# EAGLE design HPFC-V1 (EAGLE 9.7.0)
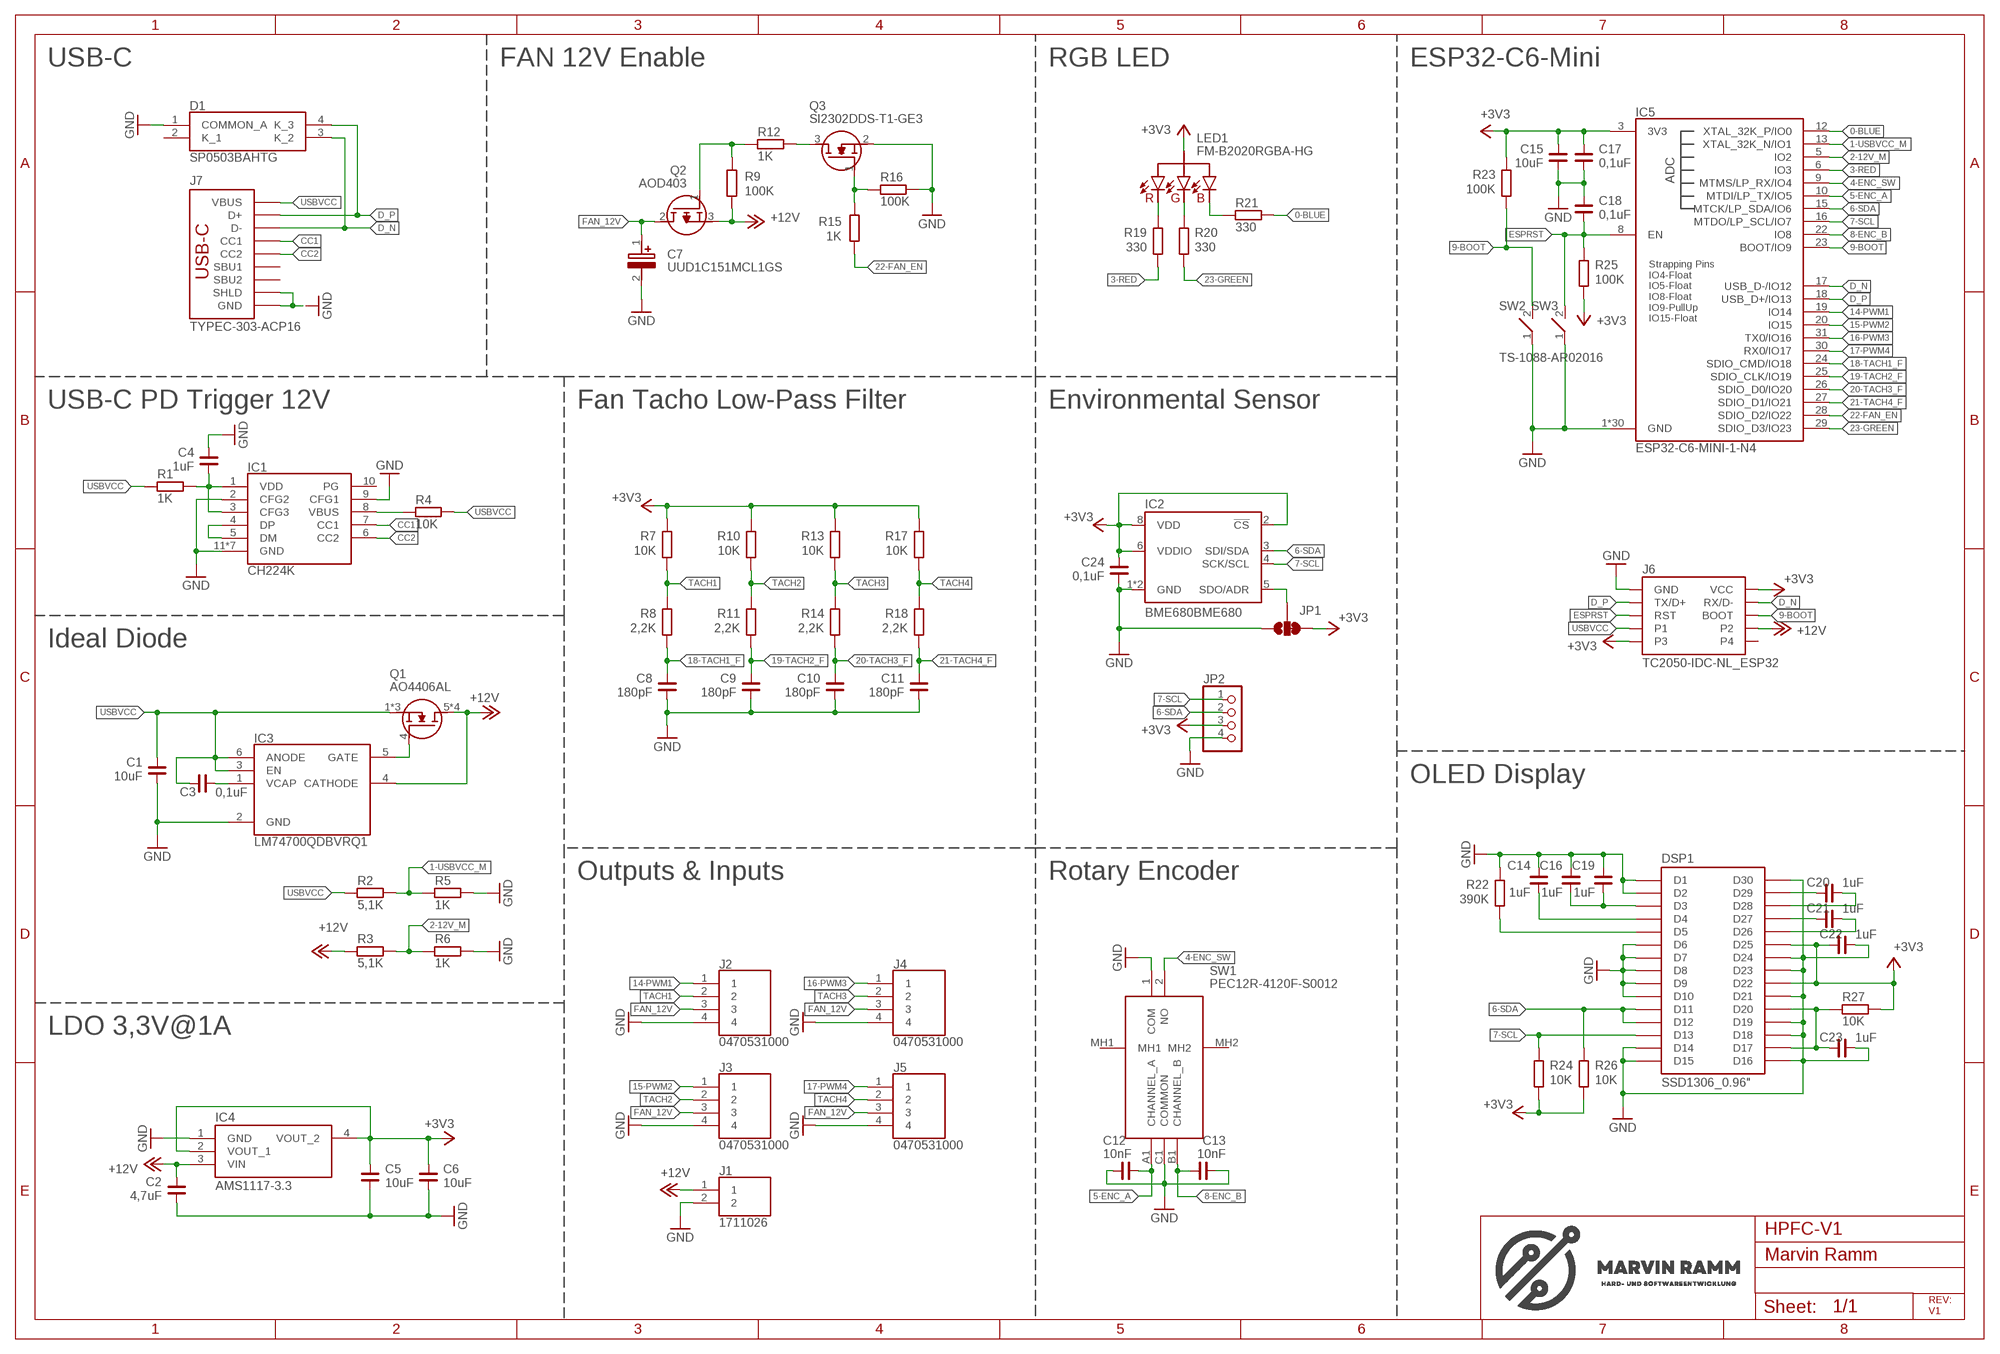
[diagram p0: schematic, sheet 1]

## Parts
C1  10uF  C_900603  [C0603]
C2  4,7uF  C_900603  [C0603]
C3  0,1uF  C_0402  [C0402]
C4  1uF  C_900402  [C0402]
C5  10uF  C_900603  [C0603]
C6  10uF  C_900603  [C0603]
C7  UUD1C151MCL1GS  [CAPAE660X800N]
C8  180pF  C_900402  [C0402]
C9  180pF  C_900402  [C0402]
C10  180pF  C_900402  [C0402]
C11  180pF  C_900402  [C0402]
C12  10nF  C_0402  [C0402]
C13  10nF  C_0402  [C0402]
C14  1uF  C_900402  [C0402]
C15  10uF  C_900603  [C0603]
C16  1uF  C_900402  [C0402]
C17  0,1uF  C_900402  [C0402]
C18  0,1uF  C_900402  [C0402]
C19  1uF  C_900402  [C0402]
C20  1uF  C_0402  [C0402]
C21  1uF  C_0402  [C0402]
C22  1uF  C_0402  [C0402]
C23  1uF  C_0402  [C0402]
C24  0,1uF  C_900402  [C0402]
D1  SP0503BAHTG  [SP0503BAHTG]
DSP1  SSD1306_0.96"  [SSD1306_0.96"]
IC1  CH224K  [SOP100P600X180-11N]
IC2  BME680BME680  [LGA3.0X3.0]
IC3  LM74700QDBVRQ1  [SOT95P280X145-6N]
IC4  AMS1117-3.3  [SOT229P700X180-4N]
IC5  ESP32-C6-MINI-1-N4  [ESP32C6MINI1N4]
J1  1711026  [1711026]
J2  0470531000  [0470531000]
J3  0470531000  [0470531000]
J4  0470531000  [0470531000]
J5  0470531000  [0470531000]
J6  TC2050-IDC-NL_ESP32  [TC2050-IDC-NL]
J7  TYPEC-303-ACP16  [TYPEC-303-ACP16]
JP1  JUMPER-SMT_3_1-NC_TRACE_SILK  [SMT-JUMPER_3_1-NC_TRACE_SILK]
JP2  PINHD-1X4  [1X04]
LED1  FM-B2020RGBA-HG  [FMB2020RGBAHG]
Q1  AO4406AL  [SOIC127P600X175-8N]
Q2  AOD403  [AOD480]
Q3  SI2302DDS-T1-GE3  [SOT95P237X112-3N]
R1  1K  R_0402  [R0402]
R2  5,1K  R_0402  [R0402]
R3  5,1K  R_0402  [R0402]
R4  10K  R_0402  [R0402]
R5  1K  R_0402  [R0402]
R6  1K  R_0402  [R0402]
R7  10K  R_900402  [R0402]
R8  2,2K  R_900402  [R0402]
R9  100K  R_0402  [R0402]
R10  10K  R_900402  [R0402]
R11  2,2K  R_900402  [R0402]
R12  1K  R_0402  [R0402]
R13  10K  R_900402  [R0402]
R14  2,2K  R_900402  [R0402]
R15  1K  R_0402  [R0402]
R16  100K  R_0402  [R0402]
R17  10K  R_900402  [R0402]
R18  2,2K  R_900402  [R0402]
R19  330  R_900402  [R0402]
R20  330  R_900402  [R0402]
R21  330  R_0402  [R0402]
R22  390K  R_900402  [R0402]
R23  100K  R_900402  [R0402]
R24  10K  R_900402  [R0402]
R25  100K  R_900402  [R0402]
R26  10K  R_900402  [R0402]
R27  10K  R_0402  [R0402]
SW1  PEC12R-4120F-S0012  [PEC12R4230FS0024]
SW2  TS-1088-AR02016  [TS1088AR02016]
SW3  TS-1088-AR02016  [TS1088AR02016]

## Nets
0-BLUE: IC5.12(XTAL_32K_P/IO0) R21.2
1-USBVCC_M: IC5.13(XTAL_32K_N/IO1) R2.2 R5.1
2-12V_M: IC5.5(IO2) R3.2 R6.1
3-RED: IC5.6(IO3) R19.2
4-ENC_SW: IC5.9(MTMS/LP_RX/IO4) SW1.2(NO)
5-ENC_A: C12.2 IC5.10(MTDI/LP_TX/IO5) SW1.A1(CHANNEL_A)
6-SDA: DSP1.D11 DSP1.D12 IC2.3(SDI/SDA) IC5.15(MTCK/LP_SDA/IO6) JP2.2 R26.1
7-SCL: DSP1.D13 IC2.4(SCK/SCL) IC5.16(MTDO/LP_SCL/IO7) JP2.1 R24.1
8-ENC_B: C13.2 IC5.22(IO8) SW1.B1(CHANNEL_B)
9-BOOT: IC5.23(BOOT/IO9) J6.6(BOOT) R23.2 SW2.2(NO)
14-PWM1: IC5.19(IO14) J2.1
15-PWM2: IC5.20(IO15) J3.1
16-PWM3: IC5.31(TX0/IO16) J4.1
17-PWM4: IC5.30(RX0/IO17) J5.1
18-TACH1_F: C8.2 IC5.24(SDIO_CMD/IO18) R8.2
19-TACH2_F: C9.2 IC5.25(SDIO_CLK/IO19) R11.2
20-TACH3_F: C10.2 IC5.26(SDIO_D0/IO20) R14.2
21-TACH4_F: C11.2 IC5.27(SDIO_D1/IO21) R18.2
22-FAN_EN: IC5.28(SDIO_D2/IO22) R15.1
23-GREEN: IC5.29(SDIO_D3/IO23) R20.2
+3V3: C5.2 C6.2 C15.2 C17.2 C22.1 C24.2 DSP1.D22 DSP1.D25 IC2.2(!CS) IC2.6(VDDIO) IC2.8(VDD) IC4.2(VOUT_1) IC4.4(VOUT_2) IC5.3(3V3) J6.2(VCC) J6.9(P3) JP1.3 JP2.3 LED1.3(VCC) R7.1 R10.1 R13.1 R17.1 R23.1 R24.2 R25.2 R26.2 R27.2
+12V: C2.2 IC3.4(CATHODE) IC4.3(VIN) J1.1 J6.8(P2) Q1.5(D) Q1.6(D) Q1.7(D) Q1.8(D) Q2.3(S) R3.1 R9.1
CC1: IC1.7(CC1) J7.A5(CC1)
CC2: IC1.6(CC2) J7.B5(CC2)
D_N: D1.3(K_2) IC5.17(USB_D-/IO12) J6.4(RX/D-) J7.A7(D-) J7.B7(D-)
D_P: D1.4(K_3) IC5.18(USB_D+/IO13) J6.3(TX/D+) J7.A6(D+) J7.B6(D+)
ESPRST: C18.1 IC5.8(EN) J6.5(RST) R25.1 SW3.2(NO)
FAN_12V: C7.1(+) J2.3 J3.3 J4.3 J5.3 Q2.2(D)
GND: C1.1 C2.1 C4.2 C5.1 C6.1 C7.2(-) C8.1 C9.1 C10.1 C11.1 C12.1 C13.1 C14.2 C15.1 C16.2 C17.1 C18.2 C19.2 C22.2 C23.2 C24.1 D1.1(COMMON_A) DSP1.D1 DSP1.D2 DSP1.D6 DSP1.D7 DSP1.D8 DSP1.D9 DSP1.D10 DSP1.D14 DSP1.D15 DSP1.D16 DSP1.D18 DSP1.D19 DSP1.D21 DSP1.D23 DSP1.D24 DSP1.D30 IC1.2(CFG2) IC1.9(CFG1) IC1.11(GND) IC1.P$1(GND) IC1.P$2(GND) IC1.P$3(GND) IC1.P$4(GND) IC1.P$5(GND) IC1.P$6(GND) IC2.1(GND) IC2.7(GND) IC3.2(GND) IC4.1(GND) IC5.1(GND) IC5.2(GND) IC5.11(GND) IC5.14(GND) IC5.36(GND) IC5.37(GND) IC5.38(GND) IC5.39(GND) IC5.40(GND) IC5.41(GND) IC5.42(GND) IC5.43(GND) IC5.44(GND) IC5.45(GND) IC5.46(GND) IC5.47(GND) IC5.48(GND) IC5.49(GND) IC5.50(GND) IC5.51(GND) IC5.52(GND) IC5.53(GND) IC5.54(GND) IC5.55(GND) IC5.56(GND) IC5.57(GND) IC5.58(GND) IC5.59(GND) IC5.60(GND) IC5.61(GND) J1.2 J2.4 J3.4 J4.4 J5.4 J6.1(GND) J7.A1(GND) J7.A12(GND) J7.B1(GND) J7.B12(GND) J7.PD1(SHLD) J7.PD2(SHLD) J7.PD3(SHLD) J7.PD4(SHLD) JP1.1 JP2.4 Q3.2(S) R5.2 R6.2 R16.2 R22.1 SW1.1(COM) SW1.C1(COMMON) SW2.1(COM) SW3.1(COM)
N$1: C4.1 IC1.1(VDD) IC1.3(CFG3) R1.2
N$2: IC1.4(DP) IC1.5(DM)
N$3: IC1.8(VBUS) R4.1
N$4: IC3.5(GATE) Q1.4(G1)
N$5: LED1.2(B) R21.1
N$6: IC2.5(SDO/ADR) JP1.2
N$7: C3.2 IC3.1(VCAP)
N$8: Q2.1(G) R9.2 R12.1
N$10: Q3.3(D) R12.2
N$11: Q3.1(G) R15.2 R16.1
N$19: LED1.1(R) R19.1
N$20: LED1.4(G) R20.1
N$21: DSP1.D5 R22.2
N$22: C16.1 C19.1 DSP1.D3
N$23: C20.1 DSP1.D29
N$24: C14.1 DSP1.D4
N$25: C20.2 DSP1.D28
N$26: C21.1 DSP1.D27
N$27: C21.2 DSP1.D26
N$29: C23.1 DSP1.D17 DSP1.D20 R27.1
TACH1: J2.2 R7.2 R8.1
TACH2: J3.2 R10.2 R11.1
TACH3: J4.2 R13.2 R14.1
TACH4: J5.2 R17.2 R18.1
USBVCC: C1.2 C3.1 IC3.3(EN) IC3.6(ANODE) J6.7(P1) J7.A4(VBUS) J7.A9(VBUS) J7.B4(VBUS) J7.B9(VBUS) Q1.1(S) Q1.2(S) Q1.3(S) R1.1 R2.1 R4.2
Unconnected: D1.2(K_1) IC1.10(PG) J6.10(P4) J7.A8(SBU1) J7.B8(SBU2) SW1.MH1 SW1.MH2

## Notes on the sheet
- USB-C | FAN 12V Enable | RGB LED | ESP32-C6-Mini
- USB-C PD Trigger 12V | Fan Tacho Low-Pass Filter | Environmental Sensor
- Ideal Diode
- OLED Display
- Outputs & Inputs | Rotary Encoder
- LDO 3,3V@1A
- Marvin Ramm
- REV:
  V1

## Library data of the parts
C1 C2 C4-C6 C8-C11 C14-C19 C24 = rc-master-smd:C_90: NON-POLARIZED CAP
C3 C12 C13 C20-C23 = rc-master-smd:C_: NON-POLARIZED CAP
C7 = UUD1C151MCL1GS:UUD1C151MCL1GS: Cap Aluminum Lytic 150uF 16V 20% (6.3 X 7.7mm) SMD 280mA 2000h 105C Automotive T/R Source: Datasheet <https://datasheet.datasheetarchive.com/originals/dk/DKDS-9/176751.pdf>; ARROW_PART_NUMBER: UUD1C151MCL1GS; ARROW_PRICE-STOCK: https://www.arrow.com/en/products/uud1c151mcl1gs/nichicon; DESCRIPTION: Cap Aluminum Lytic 150uF 16V 20% (6.3 X 7.7mm) SMD 280mA 2000h 105C Automotive T/R; HEIGHT: 8mm; MANUFACTURER_NAME: Nichicon; MANUFACTURER_PART_NUMBER: UUD1C151MCL1GS; MOUSER_PART_NUMBER: 647-UUD1C151MCL; MOUSER_PRICE-STOCK: https://www.mouser.co.uk/ProductDetail/Nichicon/UUD1C151MCL1GS?qs=BJlw7L4Cy7%252Bigl9Xa9UoAg%3D%3D
D1 = SP0503BAHTG:SP0503BAHTG: ESD Suppressors / TVS Diodes TVS AVAL DIODE SMT Source: Datasheet <https://nl.mouser.com/datasheet/2/240/Littelfuse_TVS_Diode_Array_SP05_Datasheet.pdf-777043.pdf>; ARROW_PART_NUMBER: SP0503BAHTG; ARROW_PRICE-STOCK: https://www.arrow.com/en/products/sp0503bahtg/littelfuse?region=nac; DESCRIPTION: ESD Suppressors / TVS Diodes TVS AVAL DIODE SMT; HEIGHT: 1.22mm; MANUFACTURER_NAME: LITTELFUSE; MANUFACTURER_PART_NUMBER: SP0503BAHTG; MOUSER_PART_NUMBER: 576-SP0503BAHTG; MOUSER_PRICE-STOCK: https://www.mouser.co.uk/ProductDetail/Littelfuse/SP0503BAHTG?qs=uD%2FdkN7XIa0NTYXwHdELYA%3D%3D
DSP1 = SSD1306:SSD1306_0.96"
IC1 = CH224K:CH224K: ESSOP-10 USB ICs ROHS Source: Datasheet <https://datasheet.lcsc.com/lcsc/2204251615_WCH-Jiangsu-Qin-Heng-CH224K_C970725.pdf>; DESCRIPTION: ESSOP-10 USB ICs ROHS; HEIGHT: 1.8mm; MANUFACTURER_NAME: WCH; MANUFACTURER_PART_NUMBER: CH224K
IC2 = SparkFun-Sensors:BME680: Bosch BME680 – Combined Humidity and Pressure Sensor The BME680 is as combined digital humidity, pressure and temperature sensor based on proven sensing principles. The sensor module is housed in an extremely compact metal-lid LGA package with a footprint of only 3.0×3.0mm with a height of 0.93mm. Its small dimensions and its low power consumption allow the implementation in battery driven devices such as handsets, GPS modules or watches.
IC3 = LM74700QDBVRQ1:LM74700QDBVRQ1: Low Iq, ideal diode controller Source: Datasheet <http://www.ti.com/lit/gpn/LM74700-Q1>; ARROW_PART_NUMBER: LM74700QDBVRQ1; ARROW_PRICE-STOCK: https://www.arrow.com/en/products/lm74700qdbvrq1/texas-instruments?utm_currency=USD&region=nac; DESCRIPTION: Low Iq, ideal diode controller; HEIGHT: 1.45mm; MANUFACTURER_NAME: Texas Instruments; MANUFACTURER_PART_NUMBER: LM74700QDBVRQ1; MOUSER_PART_NUMBER: 595-LM74700QDBVRQ1; MOUSER_PRICE-STOCK: https://www.mouser.co.uk/ProductDetail/Texas-Instruments/LM74700QDBVRQ1?qs=j%252B1pi9TdxUYjAZhGV8eSkQ%3D%3D
IC4 = AMS1117-3.3:AMS1117-3.3: 1A LOW DROPOUT VOLTAGE REGULATOR, SOT-223 Source: Datasheet <http://www.advanced-monolithic.com/pdf/ds1117.pdf>; ARROW_PART_NUMBER: AMS1117-3.3; DESCRIPTION: 1A LOW DROPOUT VOLTAGE REGULATOR, SOT-223; HEIGHT: 1.8mm; MANUFACTURER_NAME: Advanced Monolithic Systems; MANUFACTURER_PART_NUMBER: AMS1117-3.3
IC5 = ESP32-C6-MINI-1-N4:ESP32-C6-MINI-1-N4: Multiprotocol Modules ESP32-C6 Module, supports Wi-Fi 6 in 2.4 GHz band, Bluetooth 5, Zigbee 3.0 and Thread - -40 to 105C Source: Datasheet <https://www.espressif.com/sites/default/files/documentation/esp32-c6-mini-1_mini-1u_datasheet_en.pdf>; DESCRIPTION: Multiprotocol Modules ESP32-C6 Module, supports Wi-Fi 6 in 2.4 GHz band, Bluetooth 5, Zigbee 3.0 and Thread - -40 to 105C; HEIGHT: mm; MANUFACTURER_NAME: Espressif Systems; MANUFACTURER_PART_NUMBER: ESP32-C6-MINI-1-N4; MOUSER_PART_NUMBER: 356-ESP32C6MINI-1-N4; MOUSER_PRICE-STOCK: https://www.mouser.co.uk/ProductDetail/Espressif-Systems/ESP32-C6-MINI-1-N4?qs=Jm2GQyTW%2FbjiJX9bVadqSw%3D%3D
J1 = 1711026:1711026: PCB terminal block, nominal current: 24 A, rated voltage (III/2): 400 V, nominal cross section: 2.5 mm?, Number of potentials: 2, Number of rows: 1, Number of positions per row: 2, product range: MKDS 3, pitch: 5 mm, connection method: Screw connection with tension sleeve, mounting: Wave soldering, conductor/PCB connection direction: 0 ?, color: green, Pin layout: Linear pinning, Solder pin [P]: 5 mm, type of packaging: packed in cardboard. The article can be aligned to create different nos. of positions! Source: Datasheet <http://www.phoenixcontact.com/de/produkte/1711026/pdf>; ARROW_PART_NUMBER: 1711026; ARROW_PRICE-STOCK: https://www.arrow.com/en/products/1711026/phoenix-contact?region=nac; DESCRIPTION: PCB terminal block, nominal current: 24 A, rated voltage (III/2): 400 V, nominal cross section: 2.5 mm?, Number of potentials: 2, Number of rows: 1, Number of positions per row: 2, product range: MKDS 3, pitch: 5 mm, connection method: Screw connection with tension sleeve, mounting: Wave soldering, conductor/PCB connection direction: 0 ?, color: green, Pin layout: Linear pinning, Solder pin [P]: 5 mm, type of packaging: packed in cardboard. The article can be aligned to create different nos. of positions!; HEIGHT: 18.2mm; MANUFACTURER_NAME: Phoenix Contact; MANUFACTURER_PART_NUMBER: 1711026; MOUSER_PART_NUMBER: 651-1711026; MOUSER_PRICE-STOCK: https://www.mouser.co.uk/ProductDetail/Phoenix-Contact/1711026?qs=JcjeNNoqGSMahJ%2FDM5awSg%3D%3D
J2-J5 = 0470531000:0470531000: Conn Wire to Board HDR 4 POS 2.54mm Solder ST Top Entry Thru-Hole KK Bag Source: Datasheet <https://www.molex.com/content/dam/molex/molex-dot-com/products/automated/en-us/salesdrawingpdf/470/47053/470531000_sd.pdf>; ARROW_PART_NUMBER: 0470531000; ARROW_PRICE-STOCK: https://www.arrow.com/en/products/0470531000/molex?utm_currency=USD&region=nac; DESCRIPTION: Conn Wire to Board HDR 4 POS 2.54mm Solder ST Top Entry Thru-Hole KK Bag; HEIGHT: mm; MANUFACTURER_NAME: Molex; MANUFACTURER_PART_NUMBER: 0470531000; MOUSER_PART_NUMBER: N/A; MOUSER_PRICE-STOCK: https://www.mouser.co.uk/ProductDetail/Molex/0470531000?qs=PBcRNPEHKsr8N9RyuOy6rw%3D%3D
J6 = TC20XX:TC2050-IDC-NL_ESP32: 10-Pin No-Legs Plug-of-Nails™ Cable with Ribbon connector.
J7 = TYPEC-303-ACP16:TYPEC-303-ACP16: 5A USB 3.1 1 Standing paste 16P Female -25℃~+85℃ Type-C SMD USB Connectors ROHS Source: Datasheet <https://www.lcsc.com/datasheet/lcsc_datasheet_2411220120_XUNPU-TYPEC-303-ACP16_C720628.pdf>
JP1 = SparkFun-Jumpers:JUMPER-SMT_3_1-NC_TRACE: Normally closed trace jumper (1 of 2 connections) This jumper has a trace between two pads so it's normally closed (NC). The other connection is normally open (NO). Use a razor knife to open the connection. For best results follow the IPC guidelines for cutting traces: Cutout at least 0.063 mm (0.005 in). Remove all loose material to clean up the cut area. Seal the cut with an approved epoxy. Reapply solder to reclose the connection, or to close the NO connection.
JP2 = pinhead:PINHD-1X4: PIN HEADER
LED1 = FM-B2020RGBA-HG:FM-B2020RGBA-HG: Light Emitting Diodes (LED) RGB 615~630nm Red, 515~535nm Green, 465~480nm Blue 35~85mcd@8mARed,100~260mcd@5mAGreen,15~40mcd@3mABlue Top View 2020 RoHS Source: Datasheet <https://datasheet.lcsc.com/szlcsc/Foshan-NationStar-Optoelectronics-FM-B2020RGBA-HG_C108793.pdf>
Q1 = AO4406AL:AO4406AL: N-Channel 30V 13A (Tc) 3.1W (Tc) Surface Mount 8-SOIC Source: Datasheet <https://datasheet.lcsc.com/szlcsc/Alpha-Omega-Semicon-AOS-AO4406AL_C35349.pdf>; DESCRIPTION: N-Channel 30V 13A (Tc) 3.1W (Tc) Surface Mount 8-SOIC; HEIGHT: 1.75mm; MANUFACTURER_NAME: Alpha & Omega Semiconductors; MANUFACTURER_PART_NUMBER: AO4406AL
Q2 = AOD403:AOD403: MOSFET P-CH 30V 15A TO252 Source: Datasheet <http://aosmd.com/res/data_sheets/AOD403.pdf>; ARROW_PART_NUMBER: AOD403; ARROW_PRICE-STOCK: https://www.arrow.com/en/products/aod403/alpha-and-omega-semiconductor?region=nac; DESCRIPTION: MOSFET P-CH 30V 15A TO252; HEIGHT: 2mm; MANUFACTURER_NAME: Alpha & Omega Semiconductors; MANUFACTURER_PART_NUMBER: AOD403
Q3 = SI2302DDS-T1-GE3:SI2302DDS-T1-GE3: SI2302DDS-T1-GE3 N-Channel MOSFET, 2.6 A, 20 V, 3-Pin SOT-363 Vishay Source: Datasheet <http://www.vishay.com/docs/63653/si2302dds.pdf>; ARROW_PART_NUMBER: SI2302DDS-T1-GE3; ARROW_PRICE-STOCK: https://www.arrow.com/en/products/si2302dds-t1-ge3/vishay; DESCRIPTION: SI2302DDS-T1-GE3 N-Channel MOSFET, 2.6 A, 20 V, 3-Pin SOT-363 Vishay; HEIGHT: 1.12mm; MANUFACTURER_NAME: Vishay; MANUFACTURER_PART_NUMBER: SI2302DDS-T1-GE3; MOUSER_PART_NUMBER: 78-SI2302DDS-T1-GE3; MOUSER_PRICE-STOCK: https://www.mouser.co.uk/ProductDetail/Vishay-Semiconductors/SI2302DDS-T1-GE3?qs=MxnWX8BLHKdaCSNWhg%252BxLA%3D%3D
R1-R6 R9 R12 R15 R16 R21 R27 = rc-master-smd:R_: RESISTOR
R7 R8 R10 R11 R13 R14 R17-R20 R22-R26 = rc-master-smd:R_90: RESISTOR
SW1 = PEC12R-4230F-S0024:PEC12R-4120F-S0012: Encoder 30mm Shaft w/Switch 24 pulses Bourns 24 Pulse Incremental Mechanical Rotary Encoder with a 6 mm Flat Shaft, Through Hole Source: Datasheet <http://www.bourns.com/data/global/pdfs/PEC12R.pdf>; ARROW_PART_NUMBER: PEC12R-4120F-S0012; ARROW_PRICE-STOCK: https://www.arrow.com/en/products/pec12r-4230f-s0024/bourns?region=nac; DESCRIPTION: Encoder 30mm Shaft w/Switch 24 pulses Bourns 24 Pulse Incremental Mechanical Rotary Encoder with a 6 mm Flat Shaft, Through Hole; HEIGHT: 30.5mm; MANUFACTURER_NAME: Bourns; MANUFACTURER_PART_NUMBER: PEC12R-4230F-S0024; MOUSER_PART_NUMBER: 652-PEC12R-4230F-S24; MOUSER_PRICE-STOCK: https://www.mouser.co.uk/ProductDetail/Bourns/PEC12R-4230F-S0024?qs=Zq5ylnUbLm78S3yGzO6hng%3D%3D
SW2 SW3 = TS-1088-AR02016:TS-1088-AR02016: Tact Switch Source: Datasheet <https://www.xunpudianzi.com/uploads/pdf/TS-1088-ARXXX.pdf>; DESCRIPTION: Tact Switch; HEIGHT: 2mm; MANUFACTURER_NAME: XUNPU; MANUFACTURER_PART_NUMBER: TS-1088-AR02016

## Board
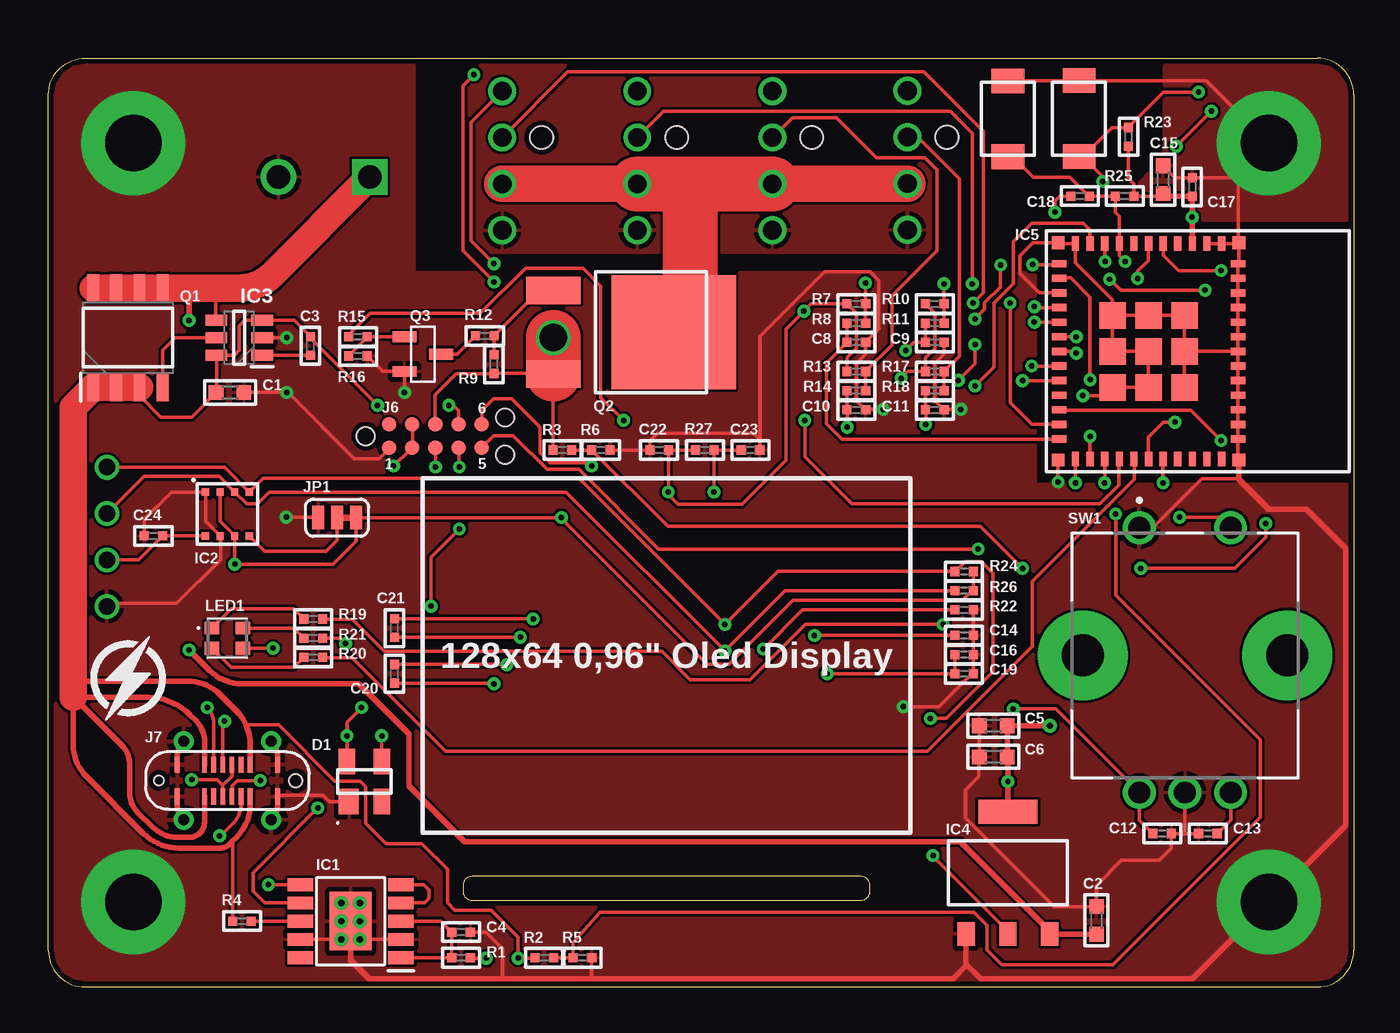
[diagram p1: board, top side]
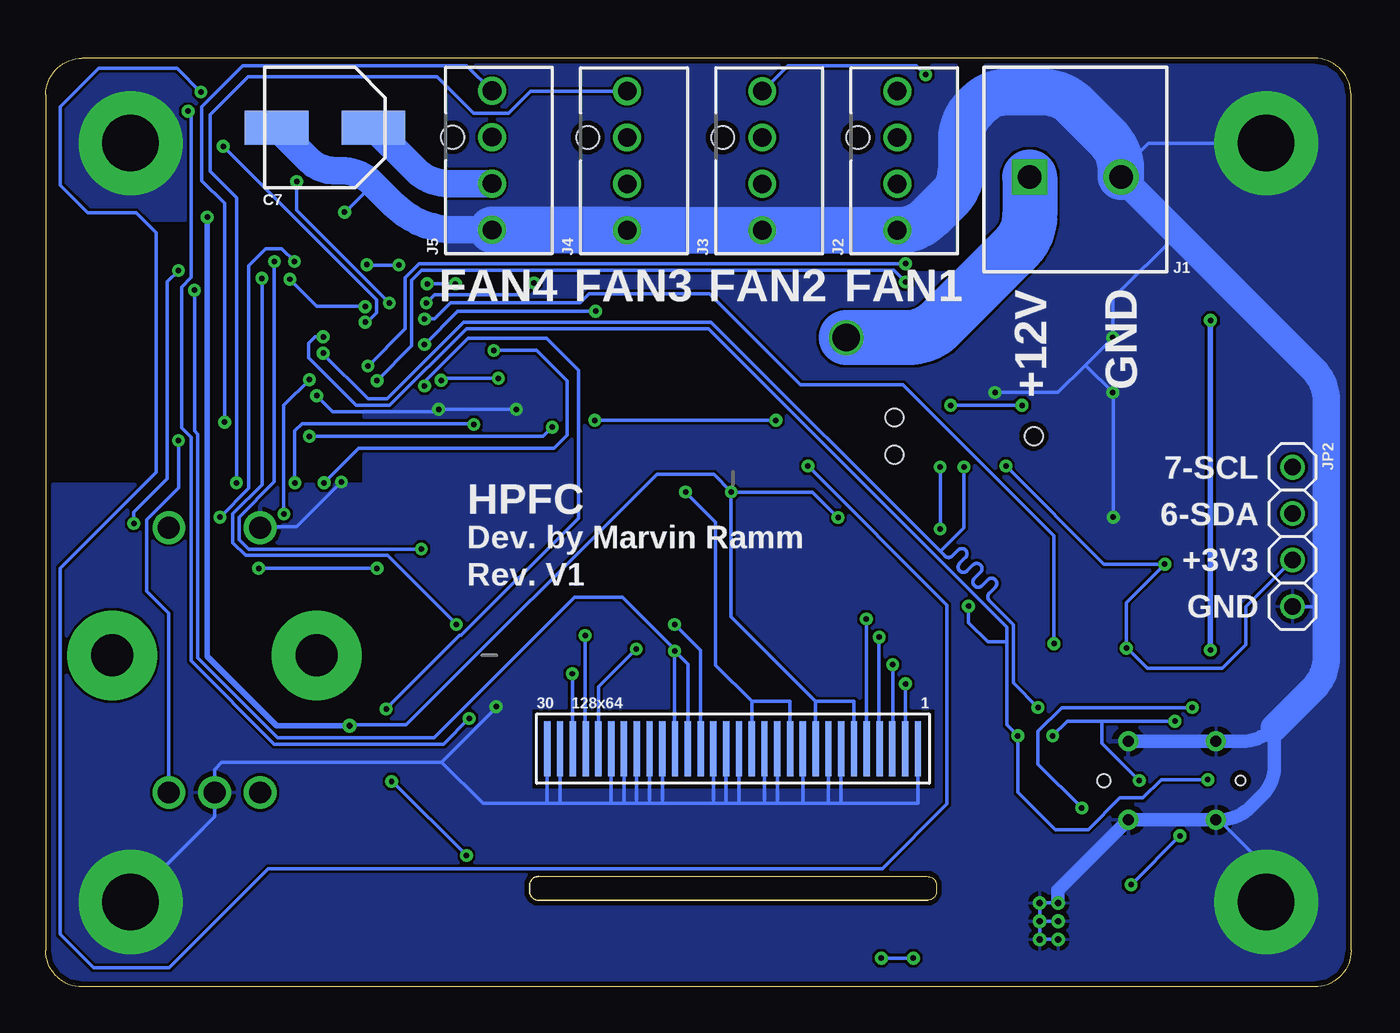
[diagram p2: board, bottom side, seen from below]

Size 71.5 x 50.85 mm. Coordinates in mm from the lower left corner, seen from the top.
Outline: 2,0 69.5,0 arc90 71.5,2 71.5,48.85 arc90 69.5,50.85 2,50.85 arc90 0,48.85 0,2 arc90 2,0
Outline: 23.2,6.05 arc90 22.7,5.55 22.7,5.25 arc90 23.2,4.75 44.5,4.75 arc90 45,5.25 45,5.55 arc90 44.5,6.05 23.2,6.05
Copper layers (1*16): Top / Bottom
Stack-up Default Layer Stack: Top User Defined 0.018mm / Dielectric-1 User Defined 1.53mm / Bottom User Defined 0.018mm
Design rules: minimum copper width 0.2mm, minimum drill size 0.3mm, copper clearance pad_smd to pad_smd 0.2mm, copper clearance smd to pad (same net) 0.2mm, copper clearance smd to smd (same net) 0.2mm, copper clearance wire_polygon to wire_polygon 0.15mm, copper clearance wire_polygon to pad_smd 0.15mm, copper clearance wire_polygon to via 0.15mm, copper clearance pad_smd to via 0.15mm, copper clearance via to via 0.15mm, copper clearance smd to via (same net) 0.15mm, dimension clearance 0.3mm, via restrict clearance 0mil, restrict clearance 0mil, drill distance 0.25mm, keepout clearance 0mil
RestrictTop: area 65.7,28.2 to 71.2,41.4; area 54.2,27.6 to 71.5,41.9
RestrictBottom: area 65.7,28.2 to 71.2,41.4; area 22.8,10.8 to 44.9,15.2; area 54.2,27.6 to 71.5,41.9

### Footprints (pad centres in the part's own frame; a part is rotated, then mirrored left to right if it is on the bottom)
C0603 = smd 0.8 x 0.8: 1 -0.762,0; 2 0.762,0
C0402 = smd 0.5 x 0.5: 1 -0.508,0; 2 0.508,0
CAPAE660X800N = smd 3.5 x 1.85: 1 -2.65,0; 2 2.65,0
SP0503BAHTG = smd 1.1 x 1.4: 1 -0.85,-1.1 | smd 0.9 x 1.4: 2 0.95,-1.1; 3 0.95,1.1; 4 -0.95,1.1
SSD1306_0.96" = smd 0.35 x 3: D1 0.175,1.5; D2 0.875,1.5; D3 1.575,1.5; D4 2.275,1.5; D5 2.975,1.5; D6 3.675,1.5; D7 4.375,1.5; D8 5.075,1.5; D9 5.775,1.5; D10 6.475,1.5; D11 7.175,1.5; D12 7.875,1.5; D13 8.575,1.5; D14 9.275,1.5; D15 9.975,1.5; D16 10.675,1.5; D17 11.375,1.5; D18 12.075,1.5; D19 12.775,1.5; D20 13.475,1.5; D21 14.175,1.5; D22 14.875,1.5; D23 15.575,1.5; D24 16.275,1.5; D25 16.975,1.5; D26 17.675,1.5; D27 18.375,1.5; D28 19.075,1.5; D29 19.775,1.5; D30 20.475,1.5
SOP100P600X180-11N = smd 1.4 x 0.7: 1 -2.75,2; 2 -2.75,1; 3 -2.75,0; 4 -2.75,-1; 5 -2.75,-2; 6 2.75,-2; 7 2.75,-1; 8 2.75,0; 9 2.75,1; 10 2.75,2 | smd 2.3 x 3.2: 11 0,0 | drill 0.35: P$1 -0.5,1; P$2 -0.5,0; P$3 0.5,0; P$4 0.5,1; P$5 -0.5,-1; P$6 0.5,-1
LGA3.0X3.0 = smd 0.4 x 0.4: 1 -1.2,1.2; 2 -0.4,1.2; 3 0.4,1.2; 4 1.2,1.2; 5 1.2,-1.2; 6 0.4,-1.2; 7 -0.4,-1.2; 8 -1.2,-1.2
SOT95P280X145-6N = smd 1.2 x 0.6: 1 -1.25,0.95; 2 -1.25,0; 3 -1.25,-0.95; 4 1.25,-0.95; 5 1.25,0; 6 1.25,0.95
SOT229P700X180-4N = smd 1.3 x 0.95: 1 -3.35,2.29; 2 -3.35,0; 3 -3.35,-2.29 | smd 1.3 x 3.25: 4 3.35,0
ESP32C6MINI1N4 = smd 0.8 x 0.4: 1 -5.9,4; 2 -5.9,3.2; 3 -5.9,2.4; 4 -5.9,1.6; 5 -5.9,0.8; 6 -5.9,0; 7 -5.9,-0.8; 8 -5.9,-1.6; 9 -5.9,-2.4; 10 -5.9,-3.2; 11 -5.9,-4; 25 5.9,-4; 26 5.9,-3.2; 27 5.9,-2.4; 28 5.9,-1.6; 29 5.9,-0.8; 30 5.9,0; 31 5.9,0.8; 32 5.9,1.6; 33 5.9,2.4; 34 5.9,3.2; 35 5.9,4 | smd 0.4 x 0.8: 12 -4.8,-4.9; 13 -4,-4.9; 14 -3.2,-4.9; 15 -2.4,-4.9; 16 -1.6,-4.9; 17 -0.8,-4.9; 18 0,-4.9; 19 0.8,-4.9; 20 1.6,-4.9; 21 2.4,-4.9; 22 3.2,-4.9; 23 4,-4.9; 24 4.8,-4.9; 36 4.8,4.9; 37 4,4.9; 38 3.2,4.9; 39 2.4,4.9; 40 1.6,4.9; 41 0.8,4.9; 42 0,4.9; 43 -0.8,4.9; 44 -1.6,4.9; 45 -2.4,4.9; 46 -3.2,4.9; 47 -4,4.9; 48 -4.8,4.9 | smd 1.45 x 1.45: 49 0,0; 54 -1.975,1.975; 55 -1.975,0; 56 -1.975,-1.975; 57 0,-1.975; 58 1.975,-1.975; 59 1.975,0; 60 1.975,1.975; 61 0,1.975 | smd 0.7 x 0.7: 50 5.95,4.95; 51 5.95,-4.95; 52 -5.95,-4.95; 53 -5.95,4.95
1711026 = drill 1.3 pad 1.95 square: 1 0,0 | drill 1.3 pad 1.95: 2 5,0
0470531000 = drill 1.02 pad 1.53: 1 0,0; 2 2.54,0; 3 5.08,0; 4 7.62,0 | hole 1.25: 2.54,-2.16
TC2050-IDC-NL = smd 0.787 x 0.787: 1 0,-1.27; 2 1.27,-1.27; 3 2.54,-1.27; 4 3.81,-1.27; 5 5.08,-1.27; 6 5.08,0; 7 3.81,0; 8 2.54,0; 9 1.27,0; 10 0,0 | hole 0.991: -1.27,-0.635; 6.35,0.381; 6.35,-1.651
TYPEC-303-ACP16 = smd 0.3 x 0.87: A1 -2.75,0.87; A4 -1.25,0.87; A5 -0.75,0.87; A6 -0.25,0.87; A7 0.25,0.87; A8 0.75,0.87; A9 1.25,0.87; A12 2.75,0.87; B1 2.75,-0.87; B4 1.25,-0.87; B5 0.75,-0.87; B6 0.25,-0.87; B7 -0.25,-0.87; B8 -0.75,-0.87; B9 -1.25,-0.87; B12 -2.75,-0.87 | drill 0.6 pad 1.1 slot 0.85: PD1 -2.4,2.15; PD2 2.4,2.15; PD3 -2.4,-2.15; PD4 2.4,-2.15 | hole 0.52: -3.75,0 | hole 0.72: 3.75,0
SMT-JUMPER_3_1-NC_TRACE_SILK = smd 0.66 x 1.27: 1 -1.041,0; 2 0,0; 3 1.041,0
1X04 = drill 0.9: 1 -3.81,0; 2 -1.27,0; 3 1.27,0; 4 3.81,0
FMB2020RGBAHG = smd 0.8 x 0.7: 1 0.85,-0.55; 2 -0.85,-0.55; 3 -0.85,0.55; 4 0.85,0.55
SOIC127P600X175-8N = smd 1.525 x 0.65: 1 -2.712,1.905; 2 -2.712,0.635; 3 -2.712,-0.635; 4 -2.712,-1.905; 5 2.712,-1.905; 6 2.712,-0.635; 7 2.712,0.635; 8 2.712,1.905
AOD480 = smd 1.5 x 3: 1 -2.286,-8.4; 3 2.286,-8.4 | smd 6.25 x 6.8: 2 0,-1.8
SOT95P237X112-3N = smd 1.3 x 0.6: 1 -0.95,0.95; 2 -0.95,-0.95; 3 1.05,0
R0402 = smd 0.5 x 0.5: 1 -0.508,0; 2 0.508,0
PEC12R4230FS0024 = drill 1.2 pad 1.8: 1 0,0; 2 5,0; A1 0,-14.5; B1 5,-14.5; C1 2.5,-14.5 | drill 2.3 pad 4.92: MH1 -3.1,-7; MH2 8.1,-7
TS1088AR02016 = smd 1.35 x 1.8: 1 -2.075,0; 2 2.075,0

### Placement (x,y rotation side)
C1  9.95,32.55 180 top
C2  57.4,3.65 270 top
C3  14.35,35.1 270 top
C4  22.6,3 0 top
C5  51.75,14.3 0 top
C6  51.75,12.6 0 top
C7  56.2,47.05 180 bottom
C8  44.25,35.3 180 top
C9  48.55,35.3 180 top
C10  44.25,31.6 180 top
C11  48.55,31.6 180 top
C12  61,8.4 180 top
C13  63.5,8.4 0 top
C14  50.15,19.25 0 top
C15  61.05,44.2 270 top
C16  50.15,18.2 0 top
C17  62.65,43.8 270 top
C18  56.5,43.3 180 top
C19  50.15,17.15 0 top
C20  18.95,17.15 90 top
C21  18.95,19.65 90 top
C22  33.45,29.4 180 top
C23  38.45,29.4 0 top
C24  5.75,24.7 0 top
D1  17.3,11.25 0 top
DSP1  44.2,11.55 0 bottom
IC1  16.55,3.6 180 top
IC2  9.8,25.9 0 top
IC3  10.45,35.55 180 top
IC4  52.55,6.25 90 top
IC5  60.25,34.8 270 top
J1  17.6,44.35 0 bottom
J2  24.85,49.05 270 bottom
J3  32.25,49.05 270 bottom
J4  39.65,49.05 270 bottom
J5  47.05,49.07 270 bottom
J6  18.65,30.8 0 top
J7  9.8,11.3 0 top
JP1  15.8,25.7 0 top
JP2  3.2,24.65 270 bottom
LED1  9.8,19.1 180 top
Q1  4.35,35.55 90 top
Q2  36.05,35.85 270 top
Q3  20.45,34.65 0 top
R1  22.6,1.6 180 top
R2  27.15,1.6 0 top
R3  28.15,29.4 0 top
R4  10.6,3.6 180 top
R5  29.25,1.6 0 top
R6  30.25,29.4 0 top
R7  44.25,37.4 0 top
R8  44.25,36.35 180 top
R9  24.4,34.1 90 top
R10  48.55,37.4 0 top
R11  48.55,36.35 180 top
R12  23.9,35.65 180 top
R13  44.25,33.7 0 top
R14  44.25,32.65 180 top
R15  16.95,35.6 0 top
R16  16.95,34.55 0 top
R17  48.55,33.7 0 top
R18  48.55,32.65 180 top
R19  14.5,20.15 0 top
R20  14.5,18.05 0 top
R21  14.5,19.1 0 top
R22  50.15,20.65 180 top
R23  59.15,46.55 90 top
R24  50.15,22.75 0 top
R25  58.95,43.3 0 top
R26  50.15,21.7 0 top
R27  35.95,29.4 180 top
SW1  59.75,25.15 0 top
SW2  56.45,47.55 270 top
SW3  52.55,47.53 270 top

### Tracks (layer width: path | path; a pad name or v marks a point on that pad's centre or on a via)
0-BLUE  (via drill 0.3)
  Top 0.2: v16.27,18.8 16.26,18.8 15.96,19.1 R21.2 | v50.75,36.58 51.27,37.1 51.27,37.45 52.15,38.33 v52.15,39.52 | v53.9,39.55 55.3,39.55 IC5.12
  Bottom 0.2: v52.15,39.52 53.88,39.52 v53.9,39.55 | v16.27,18.8 16.27,24.7 24.55,32.98 30.15,32.98 35.12,37.95 41.73,37.95 42.23,37.45 49.32,37.45 50.2,36.58 v50.75,36.58
1-USBVCC_M  (via drill 0.3)
  Top 0.2: R2.2 R5.1 28.74,2.43 30.22,4.1 50.67,4.1 51.4,3.38 51.4,2.05 52.23,1.23 58.3,1.23 66.38,9.3 66.38,13.53 58.45,21.45 v58.45,25.9 | IC5.13 55.38,38.83 56,38.83 57.05,37.77 v57.05,33.25
  Bottom 0.2: v57.05,33.25 58.45,31.85 v58.45,25.9
2-12V_M  (via drill 0.3)
  Top 0.2: R3.2 R6.1 33.92,25.23 51.05,25.23 v53.35,22.93 | v64.22,39.23 61.92,39.23 61.08,40.08 61.08,40.6 IC5.5 | v66.67,25.38 66.67,24.62 64.97,22.93 v59.83,22.93
  Bottom 0.2: v64.22,39.23 64.85,38.6 64.85,27.82 66.67,26 v66.67,25.38 | v59.83,22.93 v53.35,22.93
3-RED  (via drill 0.3)
  Top 0.2: v59.65,38.8 59.65,39.17 60.25,39.77 IC5.6 | R19.2 15.05,20.12 16.62,20.12 18.38,18.38 33.6,18.38 35.15,16.82 38.42,16.82 41.45,19.85 v49,19.85
  Bottom 0.2: v59.65,38.8 59.65,27.5 61.25,25.9 61.25,24.32 60.55,23.62 52.77,23.62 v49,19.85
4-ENC_SW  (via drill 0.3)
  Top 0.2: v57.88,39.73 57.88,40.67 IC5.9 | v61.95,25.73 64.22,25.73 64.75,25.2 SW1.2
  Bottom 0.2: v57.88,39.73 58.58,40.42 59.45,40.42 60.38,39.5 60.38,27.3 v61.95,25.73
5-ENC_A  (via drill 0.3)
  Top 0.2: C12.2 59.75,9.14 SW1.A1 55.17,15.22 v52.85,15.22 | v50.75,32.9 51.77,33.92 51.77,37.42 52.85,38.5 52.85,40.8 53.88,41.83 56.67,41.83 57.05,41.45 IC5.10
  Bottom 0.2: v50.75,32.9 50.75,33.15 48.38,35.52 44.08,35.52 42.33,33.77 42.33,25.68 48.75,19.25 48.83,19.25 v52.85,15.22
6-SDA  (via drill 0.3)
  Top 0.2: R26.1 40.35,21.7 v37.05,18.4 28.35,27.1 12.1,27.1 11.45,26.45 10.85,26.45 IC2.3 9.35,27.95 5.23,27.95 JP2.2 | IC5.15 54.05,37.2 v54,37.25 | v58.12,38.75 58.73,38.15 v63.35,38.15
  Bottom 0.2: v37.05,18.4 37.05,13.07 DSP1.D11 | DSP1.D12 36.33,17.68 v37.05,18.4 | v58.12,38.75 56.65,37.27 54.08,37.27 v54,37.25 | v63.35,38.15 63.35,30.45 63.17,30.27 63.17,18.02 58.8,13.65 50.23,13.65 42.52,21.35 39.9,21.35 37.1,18.55 v37.05,18.4
7-SCL  (via drill 0.3)
  Top 0.2: JP2.1 9.64,28.46 IC2.4 11.75,27.85 29.05,27.85 v37.05,19.85 39.95,22.75 R24.1 49.7,22.75 50.23,23.27 51.1,23.27 51.73,22.65 51.73,17.25 49.17,14.7 v48.3,14.7 | IC5.16 v54,36.4 | v63.7,47.95 v61.77,46.02
  Bottom 0.2: DSP1.D13 35.62,18.43 v37.05,19.85 | v61.77,46.02 53.38,37.62 53.38,36.92 53.9,36.4 v54,36.4 | v63.7,47.95 63.52,47.77 63.52,38.85 64.05,38.33 64.05,30.62 63.52,30.1 63.52,17.85 58.98,13.3 49.7,13.3 v48.3,14.7
8-ENC_B  (via drill 0.3)
  Top 0.2: C13.2 64.75,9.14 SW1.B1 | IC5.22 55.38,31.57 62.58,31.57 v64.22,29.93
  Bottom 0.2: v64.22,29.93 64.22,27.32 65.97,25.57 65.97,21.68 64.75,20.45 SW1.B1
9-BOOT  (via drill 0.3)
  Top 0.2: v29.75,28.52 29.57,28.7 27.48,28.7 26.93,29.25 26.93,30.65 25.38,32.2 24.38,32.2 23.75,31.57 23.75,30.8 J6.6 | v63,49 61.08,49 59.15,47.08 R23.2 58.26,47.06 56.67,45.48 SW2.2 56.62,45.48 57.75,44.35 v57.75,44.1 | IC5.23 53.88,30.8 52.67,32 v52.67,37.45
  Bottom 0.2: v29.75,28.52 22.12,20.9 22.12,10.03 25.68,6.47 59.3,6.47 64.72,1.05 68.88,1.05 70.7,2.88 70.7,22.93 65.45,28.18 65.45,41.3 66.55,42.4 69.2,42.4 70.7,43.9 70.7,48.2 68.6,50.3 64.3,50.3 v63,49 | v52.67,37.45 57.75,42.52 v57.75,44.1
14-PWM1  (via drill 0.3)
  Top 0.2: J2.1 23.15,47.35 23.15,40.85 v24.4,39.6 | v53.85,34 IC5.19
  Bottom 0.2: v24.4,39.6 51.05,39.6 51.8,38.84 51.8,36.05 v53.85,34
15-PWM2  (via drill 0.3)
  Top 0.2: v23.3,49.95 22.7,49.35 22.7,40.3 v24.4,38.6 | v53.35,33.2 IC5.20
  Bottom 0.2: J3.1 30.85,50.45 23.8,50.45 v23.3,49.95 | v24.4,38.6 25.05,39.25 50.9,39.25 51.45,38.7 51.45,35.1 v53.35,33.2
16-PWM3  (via drill 0.3)
  Top 0.2: v61.05,27.6 IC5.31
  Bottom 0.2: J4.1 44.95,49.05 46.15,47.85 48.05,47.85 50.05,49.85 60.4,49.85 62.5,47.75 62.5,44.65 61.05,43.2 v61.05,27.6
17-PWM4  (via drill 0.3)
  Top 0.2: IC5.30 60.25,30.1 61.07,30.93 v61.7,30.93
  Bottom 0.2: J5.1 48.43,50.45 60.7,50.45 62.95,48.2 62.95,44.15 61.7,42.9 v61.7,30.93
18-TACH1_F
  Top 0.2: R8.2 C8.2 42.6,34.16 42.6,30.85 43.45,30 IC5.24
19-TACH2_F  (via drill 0.3)
  Top 0.2: R11.2 C9.2 47.4,35.3 v46.95,34.85 | IC5.25 v56.25,27.6
  Bottom 0.2: v56.25,27.6 54.35,29.5 43.65,29.5 42.95,30.2 42.95,33.2 44.6,34.85 v46.95,34.85
20-TACH3_F  (via drill 0.3)
  Top 0.2: R14.2 C10.2 v43.75,30.65 | v57.05,30.15 IC5.26
  Bottom 0.2: v57.05,30.15 44.25,30.15 v43.75,30.65
21-TACH4_F  (via drill 0.3)
  Top 0.2: R18.2 C11.2 v48.05,30.8 | IC5.27 v57.85,27.6
  Bottom 0.2: v57.85,27.6 57.85,30.45 57.45,30.85 48.1,30.85 v48.05,30.8
22-FAN_EN  (via drill 0.3)
  Top 0.2: v31.5,31.02 30.25,32.27 30.25,38.38 29.27,39.35 26.12,39.35 23.65,36.88 17.62,36.88 16.45,35.7 R15.1 | v41.42,31.02 41.42,29.02 44,26.45 57.6,26.45 58.62,27.48 58.62,28.88 IC5.28
  Bottom 0.2: v41.42,31.02 v31.5,31.02
23-GREEN
  Top 0.2: IC5.29 59.48,28.88 59.48,27.8 53.9,22.23 53.9,18.65 48.15,12.9 21.75,12.9 16.62,18.02 15.05,18.02 R20.2
+3V3  (via drill 0.3, 0.35)
  Top 0.2: C22.1 34,29.4 | 34,29.4 R27.2 | R24.2 R26.2 50.58,21.7 50.05,21.18 40.77,21.18 37.27,17.68 36.08,17.68 28.1,25.65 v28.1,25.7 JP1.3 16.84,24.39 15.6,23.15 v10.2,23.15 IC2.6 9.4,25.5 IC2.2 | IC2.8 C24.2 4.94,23.38 JP2.3 | 34,29.4 33.95,29.35 v33.95,27.1 33.95,26.95 34.48,26.43 37.98,26.43 40.4,28.85 40.4,36.02 v41.38,37 41.77,37.4 R7.1 44.26,36.88 44.26,34.96 43.74,34.45 R13.1 | v12.3,18.55 LED1.3 | R10.1 48.54,36.9 48.54,34.95 48.04,34.45 R17.1 47.08,33.7 v46.7,33.33 | R23.1 59.15,44.3 59.46,43.99 R25.2 60.91,43.3 C15.2 | 52.55,2.77 IC4.2 52.55,3.05 48.45,7.15 v48.45,7.2 | C5.2 52.5,14.35 | v50.75,35.17 50.75,34.12 v49.84,33.21 | J6.9 19.95,30.8 19.95,29.57 J6.2 19.77,29.4 v18.9,28.52
  Top 0.3: IC4.4 v52.55,11.25 52.55,12.56 C6.2 C5.2 v54.85,14.3 | C15.2 61.2,43.29 C17.2 v62.65,42.15 IC5.3
  Bottom 0.2: DSP1.D25 27.23,15.65 29.32,15.65 | DSP1.D22 29.32,15.65 | 29.32,15.65 33.95,20.27 v33.95,27.1 | v28.1,25.7 29.5,27.1 v33.95,27.1 | v50.75,35.17 48.92,37 v41.38,37 | JP2.3 3.33,23.27 3.33,23.25 5.75,20.82 5.75,18.75 7.05,17.45 11.15,17.45 12.25,18.55 v12.3,18.55 12.3,21.05 v10.2,23.15 13.53,23.15 v18.9,28.52 | v54.85,14.3 54.77,14.35 51.75,14.35 38.02,28.07 34.9,28.07 33.95,27.12 v33.95,27.1 | v48.45,7.2 52.5,11.25 v52.55,11.25 | v49.84,33.21 49.73,33.33 v46.7,33.33
  Bottom 0.3: v62.65,42.15 62.65,18.1 58.85,14.3 v54.85,14.3
+12V  (via drill 0.3, 1.5)
  Top 0.2: IC3.4 9.15,36.55 9.15,38.26 | R3.1 Q2.3 27.62,33.59 R9.1 24.39,33.58 22.32,33.58 21.18,32.42 21.18,30.8 J6.8
  Top 0.3: C2.2 57.39,2.9 IC4.3 54.84,3.05 49.94,7.95 22.8,7.95 19.75,11 19.75,13.85 17,16.6 10.6,16.6 arc-45 8.81,17.34 v7.7,18.45 | v7.7,36.5 7.7,38.21 7.65,38.26
  Top 1.5: Q1.8 Q1.7 Q1.6 Q1.5 7.65,38.26 9.15,38.26 10.46,38.26 arc45 12.26,39.01 J1.1
  Top 3: v27.65,35.55 Q2.3
  Bottom 0.3: v7.7,36.5 v7.7,18.45
  Bottom 3: J1.1 17.6,42.25 arc45 18.34,40.46 22.51,36.29 arc45 24.3,35.55 v27.65,35.55
CC1  (via drill 0.3)
  Top 0.2: IC1.7 11.85,4.6 11.2,5.25 11.2,6.25 v14.75,9.8 | v8.7,15.3 arc-45 9.05,14.46 J7.A5
  Bottom 0.2: v8.7,15.3 15.85,15.3 17.15,14 17.15,12.2 v14.75,9.8
CC2  (via drill 0.3)
  Top 0.2: v12.05,5.6 IC1.6 | J7.B5 10.55,10.04 arc-45 10.1,8.95 9.47,8.32 arc-45 v9.37,8.28
  Bottom 0.2: v9.37,8.28 v12.05,5.6
D_N  (via drill 0.3)
  Top 0.2: J7.B7 9.55,11.05 | 9.55,11.05 10.05,11.55 J7.A7 | 9.55,11.05 9.25,11.35 v7.85,11.35 | D1.3 v18.25,13.75 | v56.3,35.6 IC5.17 | J6.4 22.5,29.49 v22.5,28.48 | v22.5,25.07 20.95,23.52 v20.95,20.85
  Bottom 0.2: v7.85,11.35 10.4,11.35 11.4,10.35 12.65,10.35 14.4,8.6 16.2,8.6 18.25,10.65 v18.25,13.75 18.85,14.35 18.85,18.9 | 18.85,18.9 18.85,19.7 35.2,36.05 48.45,36.05 52.65,31.85 54.49,31.85 57.1,34.45 57.1,35.24 56.74,35.6 v56.3,35.6 | v22.5,28.48 v22.5,25.07 | v20.95,20.85 20.95,19.95 19.9,18.9 18.85,18.9
D_P  (via drill 0.3)
  Top 0.2: J7.B6 10.05,11.01 10.35,11.3 v11.6,11.3 | D1.4 v16.35,13.75 16.35,14.5 v17.15,15.3 | IC5.18 56.2,34.8 v56.3,34.7 | v21.2,28.48 J6.3 | J7.A6 9.55,14.31 arc-45 v9.65,14.55
  Bottom 0.2: 13.65,14.55 15.55,14.55 v16.35,13.75 | v11.6,11.3 13.65,13.35 13.65,14.55 | 13.65,14.55 v9.65,14.55 | v17.15,15.3 18.5,16.65 18.5,19.84 19.81,21.16 arc90 19.81,21.57 19.49,21.89 arc-90 19.49,22.3 arc-90 19.89,22.3 20.22,21.97 arc90 20.63,21.97 arc90 20.63,22.38 20.3,22.7 arc-90 20.3,23.11 arc-90 20.71,23.11 21.03,22.78 arc90 21.44,22.78 arc90 21.44,23.19 21.11,23.52 arc-90 21.11,23.92 arc-52 21.35,24 arc-38 21.52,23.92 21.85,23.6 arc90 22.25,23.6 22.5,23.85 | 22.5,23.85 35.05,36.4 48.59,36.4 52.8,32.2 53.85,32.2 56.33,34.67 v56.3,34.7 | v21.2,28.48 21.2,25.15 22.5,23.85
ESPRST  (via drill 0.3)
  Top 0.2: J6.5 23.73,29.55 24.37,30.2 25.46,30.2 27.3,28.35 29.05,28.35 33.42,23.98 v50.92,23.98 | v58.98,39.73 58.65,40.05 IC5.8 58.65,42.2 58.44,42.41 R25.1 C18.1 56.88,43.4 55.95,44.33 53.95,44.33 52.95,45.33 52.67,45.33 SW3.2
  Bottom 0.2: v50.92,23.98 60.38,23.98 60.9,24.5 60.9,25.73 58.98,27.65 v58.98,39.73
FAN_12V
  Top 2: J2.3 J3.3 | J4.3 47,43.97 arc45 J5.3
  Top 3: J3.3 34.55,43.97 | 34.55,43.97 J4.3 | 34.55,43.97 arc-45 35.15,42.52 35.15,35.3 arc-45 34.55,35.55 Q2.2
  Bottom 1.5: C7.1 51.23,44.73 arc-45 49.44,43.99 J5.3
GND  (via drill 0.3, 3.1 pad 5.7)
  Top 0.2: 62.25,8.4 C12.1 61.51,7.58 60.85,6.92 58.77,6.92 57.4,5.55 57.4,4.55 | 62.25,8.4 C13.1 | SW1.C1 62.25,8.4 | R22.1 C14.2 C16.2 C19.2 50.58,17.15 48.77,15.35 v46.83,15.35 | C24.1 5.24,25.6 6.74,27.1 IC2.1 8.6,25.5 IC2.7 9.43,24.68 9.43,23.4 7.03,21 3.33,21 JP2.4 | R16.2 18.31,33.7 Q3.2 v19.5,32.55 | IC5.53 65.2,39.65 IC5.48 IC5.47 IC5.46 IC5.45 IC5.44 IC5.43 IC5.42 | IC5.42 62.25,34.8 | 62.25,34.8 IC5.61 IC5.54 IC5.55 IC5.56 | IC5.56 IC5.57 IC5.49 IC5.59 IC5.58 58.27,32.73 57.92,32.38 v56.65,32.38 | IC5.60 62.23,34.77 62.25,34.8 | IC5.42 IC5.41 IC5.40 IC5.39 IC5.38 IC5.37 IC5.36 65.15,28.9 IC5.50 | IC1.2 IC1.P$1 | IC1.9 IC1.P$4 | SW3.1 52.57,49.62 SW2.1 63.42,49.62 v66.85,46.2 | C15.1 61.7,44.31 C17.1 64.96,44.31 v66.85,46.2 | C9.1 49.06,34.65 48.55,34.14 48.55,32.11 C11.1 49.1,31.62 v49.98,31.62 | IC5.2 IC5.1 65.15,40.7 IC5.53 | IC3.2 v13.05,35.55 | C1.1 v13.05,32.55 13.12,32.55 16.75,28.93 18.1,28.93 18.65,29.48 J6.1 | C5.1 51,14.29 51,12.61 C6.1 50.98,12.6 50.98,11.53 50.23,10.78 50.23,9.28 55.1,4.4 57.25,4.4 57.4,4.55 | 57.4,4.55 C2.1 | R6.2 C22.2 32.94,29.92 33.35,30.32 38.62,30.32 38.96,29.99 C23.2 38.96,29.93 38.98,29.93 38.98,35.62 42.5,39.15 45.02,39.15 45.5,38.67 45.5,36.05 44.8,35.35 C8.1 44.76,34.65 44.25,34.14 44.25,32.11 C10.1 44.77,31.62 v45.73,31.62 | v55.3,27.65 IC5.51 | IC5.14 54.27,38 53.2,39.08 53.2,40.02 53.92,40.75 IC5.52 55.35,40.7 IC5.11 56.25,39.65 58.27,37.62 IC5.56 | 24.88,0.45 24.88,2.1 23.98,3 C4.2 | 29.75,0.45 29.75,1.57 R5.2 | SW1.1 59.85,25.2 60.55,25.2 63.17,27.82 65.1,27.82 65.2,27.8 | v66.85,46.2 65.17,44.52 65.17,40.75 IC5.53
  Top 0.2: C18.2 55.39,43.3 55.12,43.03 v55.12,42.42 | v13.03,25.73 14.7,25.73 JP1.1 | D1.1 15.4,10.15 15.05,10.5 12.6,10.5 J7.B1 | IC1.11 16.62,3.67 16.98,3.67 IC1.P$2
  Top 0.3: J7.A1 7.05,12.61 arc-45 J7.PD1 | J7.B12 7.05,9.99 arc45 J7.PD3 | J7.PD4 arc45 12.55,9.99 J7.B1 | J7.A12 12.55,12.61 arc45 J7.PD2 | IC1.11 16.55,1.45 17.55,0.45 24.88,0.45 29.75,0.45 49.56,0.45 50.26,1.15 IC4.1 50.26,1.25 51.06,0.45 62.65,0.45 v66.85,4.65 71.05,8.85 71.05,24 68.9,26.15 66.85,26.15 65.2,27.8 IC5.50
  Bottom 0.2: IC1.P$3 IC1.P$2 | IC1.P$2 IC1.P$5 IC1.P$6 | IC1.P$4 IC1.P$1 IC1.P$2 | DSP1.D30 23.73,10.05 27.93,10.05 | DSP1.D24 27.93,10.05 | 27.93,10.05 28.62,10.05 | 28.62,10.05 DSP1.D23 | 28.62,10.05 30.02,10.05 | 30.02,10.05 DSP1.D21 | 30.02,10.05 31.43,10.05 | DSP1.D19 31.43,10.05 | 31.43,10.05 32.12,10.05 | DSP1.D18 32.12,10.05 | DSP1.D16 33.52,10.05 | 33.52,10.05 32.12,10.05 | 33.52,10.05 34.23,10.05 | 34.23,10.05 DSP1.D15 | 34.23,10.05 34.92,10.05 | 34.92,10.05 DSP1.D14 | 34.92,10.05 37.73,10.05 | DSP1.D10 37.73,10.05 | 37.73,10.05 38.42,10.05 | DSP1.D9 38.42,10.05 | 38.42,10.05 39.12,10.05 | DSP1.D8 39.12,10.05 | 39.12,10.05 39.83,10.05 | 39.83,10.05 DSP1.D7 | 39.83,10.05 40.52,10.05 | 40.52,10.05 DSP1.D6 | 40.52,10.05 43.33,10.05 | 43.33,10.05 DSP1.D2 | 43.33,10.05 44.02,10.05 | 44.02,10.05 DSP1.D1 | 9.5,41.25 13.05,37.7 v13.05,35.55 14.57,34.02 | 14.57,34.02 16.05,32.55 v19.5,32.55 | 14.57,34.02 14.53,34.02 v13.05,32.55 13.03,32.52 v13.03,25.73 | v4.65,4.65 4.65,6.55 7.25,9.15 | v4.65,46.2 11.1,46.2 12.6,44.7 | 49.81,12.31 46.83,15.3 v46.83,15.35 | 49.81,12.31 49.83,12.3 61.85,12.3 62.25,11.9 SW1.C1 62.25,9.32 66.85,4.72 v66.85,4.65 | v45.73,31.62 v49.98,31.62 50.1,31.5 55.77,31.5 v56.65,32.38 | v55.3,27.65 57.75,25.2 59.67,25.2 SW1.1 | 1.35,20.82 3.15,20.82 JP2.4 | v55.12,42.42 arc-45 55.06,42.45 53.56,43.96 | 44.02,10.05 47.55,10.05 49.81,12.31
  Bottom 0.75: J7.PD2 J7.PD1 6,13.45 arc-45 4.21,14.19 4.21,12.05 arc45 4.85,10.5 5.46,9.89 arc45 7.25,9.15 J7.PD3 9.01,9.15 9.73,9.15 J7.PD4 16.05,5.3 IC1.P$6
  Bottom 1.5: 4.21,14.19 2.09,16.31 arc-45 1.35,18.1 1.35,20.82 1.35,32.05 arc-45 2.09,33.84 9.5,41.25 J1.2 | C7.2 57.07,45.27 arc-45 55.7,44.7 55.35,44.7 arc45 53.56,43.96 52.5,42.9 arc-45 49,41.45 J5.4
  Bottom 2.54: J5.4 39.7,41.45 arc45 J4.4 J3.4 J2.4 24.82,41.43 arc-45 23.03,42.17 22,43.2 arc-45 21.35,44.77 21.35,46.35 arc45 20.61,48.14 20.4,48.35 arc45 18.83,49 16.9,49 arc45 15.11,48.26 13.34,46.49 arc45 12.6,44.7 J1.2
  pour Top: 0,50.85 20.1,50.85 20.1,39.2 54.8,39.2 61.05,45.45 61.05,50.85 71.5,50.85 71.5,0 0,0
  pour Top: 21.55,50.85 21.55,40.15 49.6,40.15 49.6,50.85
  pour Bottom: 21.55,50.85 21.55,40.15 49.6,40.15 49.6,50.85
  pour Bottom: 0,50.85 20.1,50.85 20.1,39.2 54.8,39.2 61.05,45.45 61.05,50.85 71.5,50.85 71.5,0 0,0
N$1
  Top 0.2: IC1.1 R1.2 C4.1 21.49,3.6 IC1.3
N$2
  Top 0.2: IC1.5 20.55,5.6 20.85,5.3 20.85,4.85 20.6,4.6 IC1.4
N$3
  Top 0.2: IC1.8 R4.1
N$4
  Top 0.2: IC3.5 6.95,35.55 6.25,34.85 Q1.4
N$5
  Top 0.2: LED1.2 13.44,19.65 R21.1
N$6
  Top 0.2: IC2.5 11.85,23.85 15.2,23.85 15.8,24.45 JP1.2
N$7
  Top 0.2: IC3.1 C3.2
N$8
  Top 0.2: R9.2 R12.1 26.66,37.9 27.41,37.9 Q2.1
N$10
  Top 0.2: Q3.3 22.39,34.65 R12.2
N$11
  Top 0.2: R16.1 17.46,35.57 R15.2 Q3.1
N$19
  Top 0.2: LED1.1 10,20.7 13.44,20.7 R19.1
N$20
  Top 0.2: LED1.4 10,17.5 13.44,17.5 R20.1
N$21  (via drill 0.3)
  Top 0.2: R22.2 41.3,20.65 v39.15,18.5
  Bottom 0.2: v39.15,18.5 39.17,18.5 41.23,16.45 DSP1.D5
N$22  (via drill 0.3)
  Top 0.2: C16.1 C19.1 v42.65,17.15
  Bottom 0.2: v42.65,17.15 42.65,13.07 DSP1.D3
N$23  (via drill 0.3)
  Top 0.2: C20.1 24.36,16.64 v24.4,16.6
  Bottom 0.2: v24.4,16.6 24.4,13.07 DSP1.D29
N$24  (via drill 0.3)
  Top 0.2: C14.1 v41.95,19.25
  Bottom 0.2: v41.95,19.25 41.95,13.07 DSP1.D4
N$25  (via drill 0.3)
  Top 0.2: C20.2 v25.09,17.66 v25.1,17.65
  Bottom 0.2: v25.1,17.65 25.1,13.07 DSP1.D28
N$26  (via drill 0.3)
  Top 0.2: C21.1 v25.84,19.14 v25.85,19.15
  Bottom 0.2: v25.85,19.15 25.85,13.07 DSP1.D27
N$27  (via drill 0.3)
  Top 0.2: C21.2 v26.54,20.16 v26.55,20.15
  Bottom 0.2: v26.55,20.15 26.55,13.07 DSP1.D26
N$29  (via drill 0.3)
  Top 0.2: C23.1 36.55,29.4 | 36.55,29.4 R27.1 v36.46,27.11 v36.45,27.1 | 36.45,29.3 36.55,29.4
  Bottom 0.2: DSP1.D17 32.83,15.65 | 32.83,15.65 30.73,15.65 DSP1.D20 | v36.45,27.1 34.8,25.45 34.8,17.62 32.83,15.65
TACH1  (via drill 0.3)
  Top 0.2: R8.1 R7.2 v44.76,38.54 v44.75,38.55 | J2.2 28.44,50.1 47.95,50.1 51.2,46.85 51.2,38 v50.65,37.45
  Bottom 0.2: v44.75,38.55 45.4,37.9 50.2,37.9 v50.65,37.45
TACH2  (via drill 0.3)
  Top 0.2: R11.1 R10.2 v49.06,38.49 v49.05,38.5 | J3.2 33.69,47.95 49.4,47.95 50.6,46.75 v50.6,38.5
  Bottom 0.2: v49.05,38.5 v50.6,38.5
TACH3
  Top 0.2: R14.1 R13.2 46.2,35.14 46.2,37.85 48.65,40.3 48.65,44.74 47.99,45.4 45.35,45.4 43.15,47.6 40.74,47.6 J4.2
TACH4
  Top 0.2: R18.1 R17.2 49.9,34.54 49.9,44.25 47.62,46.53 J5.2
USBVCC  (via drill 0.3)
  Top 0.2: Q1.3 4.99,32.37 6.15,31.2 7.84,31.2 C1.2 9.2,32.56 IC3.6 10.2,34.6 10.45,34.85 10.45,36.2 10.75,36.5 IC3.3 13.46,36.5 C3.1 14.35,35.52 v18.02,31.85 | R4.2 10.09,7.96 10.07,7.97 | v23.98,1.57 23.27,1.57 R1.1 | R2.1 26.6,1.57 v25.73,1.57 25.73,2.73 24.25,4.2 22.25,4.2 21.85,4.6 21.85,6.45 20.45,7.85 18.5,7.85 17.38,8.97 17.38,10.97 17.07,11.28 15.68,11.28 12.6,14.35 10.85,14.35 10.83,14.34 | v21.93,31.85 22.15,31.85 22.46,31.54 J6.7
  Top 0.3: J7.A4 8.55,13.43 arc45 8.08,14.57 7.74,14.91 arc45 5.46,15.85 1.34,15.85 1.35,15.85 1.35,13.3 arc45 2.09,11.51 5.2,8.4 arc45 7.13,7.6 9.35,7.6 arc45 9.95,7.85 10.07,7.97 10.31,8.21 arc45 11.05,10 J7.B4 | J7.A9 11.05,13.3 arc24 10.83,14.34 arc21 10.31,15.09 9.39,16.01 arc45 7.6,16.75 1.34,16.75 arc45 1.94,15.31 4.01,13.24 arc-45 4.45,12.18 4.45,10.64 arc45 4.9,9.55 5.68,8.77 arc45 7.05,8.2 7.77,8.2 arc45 8.28,8.41 arc45 8.55,9.07 J7.B9
  Top 1.5: Q1.3 Q1.2 Q1.1 1.34,31.74 1.34,16.75 1.34,15.85
  Bottom 0.2: v25.73,1.57 v23.98,1.57 | v18.02,31.85 v21.93,31.85

### Text on the board
SilkscreenBottom: FAN1 | FAN2 | FAN3 | FAN4 | GND | +12V | 7-SCL | 6-SDA | HPFC | Dev. by Marvin Ramm | +3V3 | Rev. V1 | GND